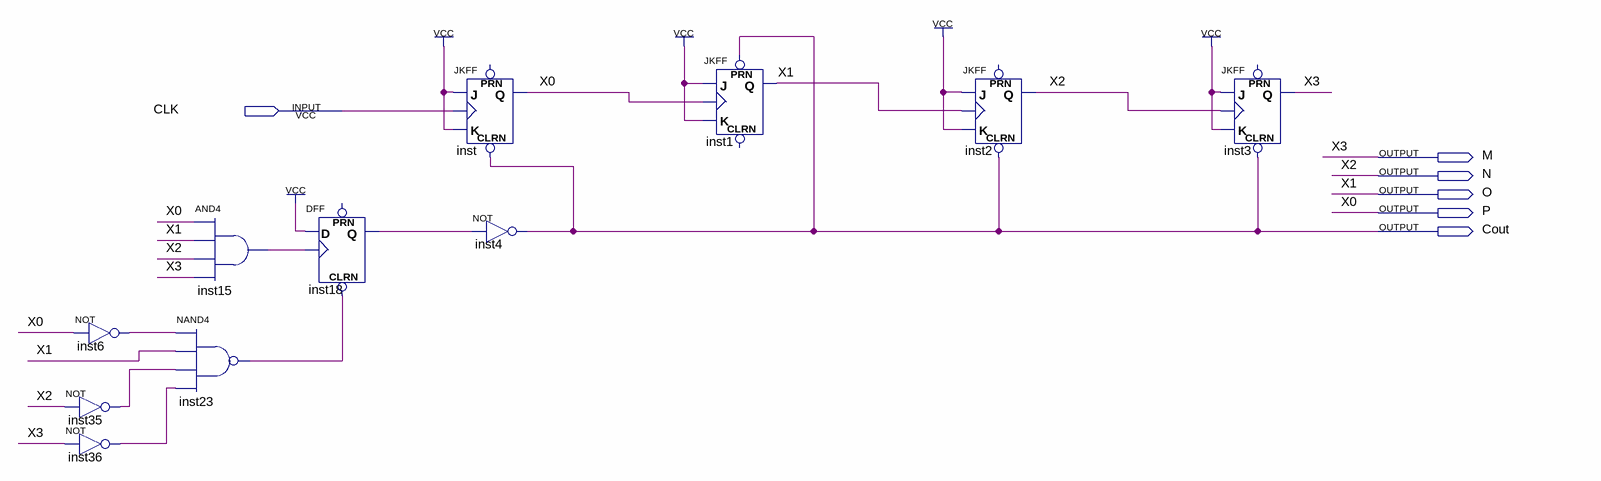
[diagram p0: schematic sheet]
// Quartus schematic Contador_Decre_3.bdf as structural Verilog: 11 symbols, 6 pins
module Contador_Decre_3 (
  input  CLK,
  output M,
  output N,
  output O,
  output P,
  output Cout
);

  wire inst6_out, inst15_out, inst18_q, inst23_out, inst35_out, inst36_out;

  not inst6 (inst6_out, P);
  not inst35 (inst35_out, N);
  not inst36 (inst36_out, M);
  and inst15 (inst15_out, P, O, N, M);
  nand inst23 (inst23_out, inst6_out, O, inst35_out, inst36_out);
  DFF inst18 (.CLRN(inst23_out), .CLK(inst15_out), .D(1'b1), .Q(inst18_q));  // open: PRN
  JKFF inst (.CLRN(Cout), .K(1'b1), .J(1'b1), .CLK(CLK), .Q(P));  // open: PRN
  not inst4 (Cout, inst18_q);
  JKFF inst1 (.PRN(Cout), .K(1'b1), .J(1'b1), .CLK(P), .Q(O));  // open: CLRN
  JKFF inst2 (.CLRN(Cout), .K(1'b1), .J(1'b1), .CLK(O), .Q(N));  // open: PRN
  JKFF inst3 (.CLRN(Cout), .K(1'b1), .J(1'b1), .CLK(N), .Q(M));  // open: PRN

  // Other names for the same wires on the sheet: X0 = P; X1 = O; X2 = N; X3 = M
endmodule
